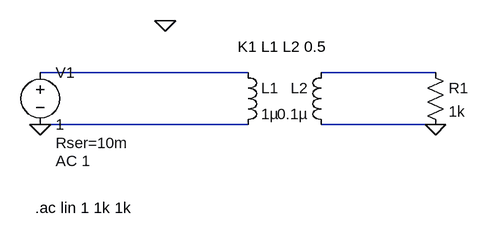
[diagram p0: schematic simple_transformer.asc]
simple_transformer.asc, the LTspice schematic file:
Version 4.1
SHEET 1 880 680
WIRE 128 80 -192 80
WIRE 416 80 240 80
WIRE 128 160 -192 160
WIRE 416 160 240 160
FLAG -192 160 0
FLAG 416 160 0
FLAG 0 0 0
SYMBOL ind 112 64 R0
SYMATTR InstName L1
SYMATTR Value 1µ
SYMATTR Type ind
SYMATTR SpiceLine Rser=1m
SYMBOL ind 256 64 M0
SYMATTR InstName L2
SYMATTR Value 0.1µ
SYMATTR Type ind
SYMATTR SpiceLine Rser=1m
SYMBOL voltage -192 64 R0
WINDOW 123 24 152 Left 2
WINDOW 39 24 124 Left 2
SYMATTR InstName V1
SYMATTR Value 1
SYMATTR Value2 AC 1
SYMATTR SpiceLine Rser=10m
SYMBOL res 400 64 R0
SYMATTR InstName R1
SYMATTR Value 1k
TEXT 112 40 Left 2 !K1 L1 L2 0.5
TEXT -200 288 Left 2 !.ac lin 1 1k 1k

The netlist it stands for:
* simple_transformer.asc
L1 N001 0 1µ Rser=1m
L2 N002 0 0.1µ Rser=1m
V1 N001 0 1 AC 1 Rser=10m
R1 N002 0 1k
K1 L1 L2 0.5
.ac lin 1 1k 1k
.backanno
.end